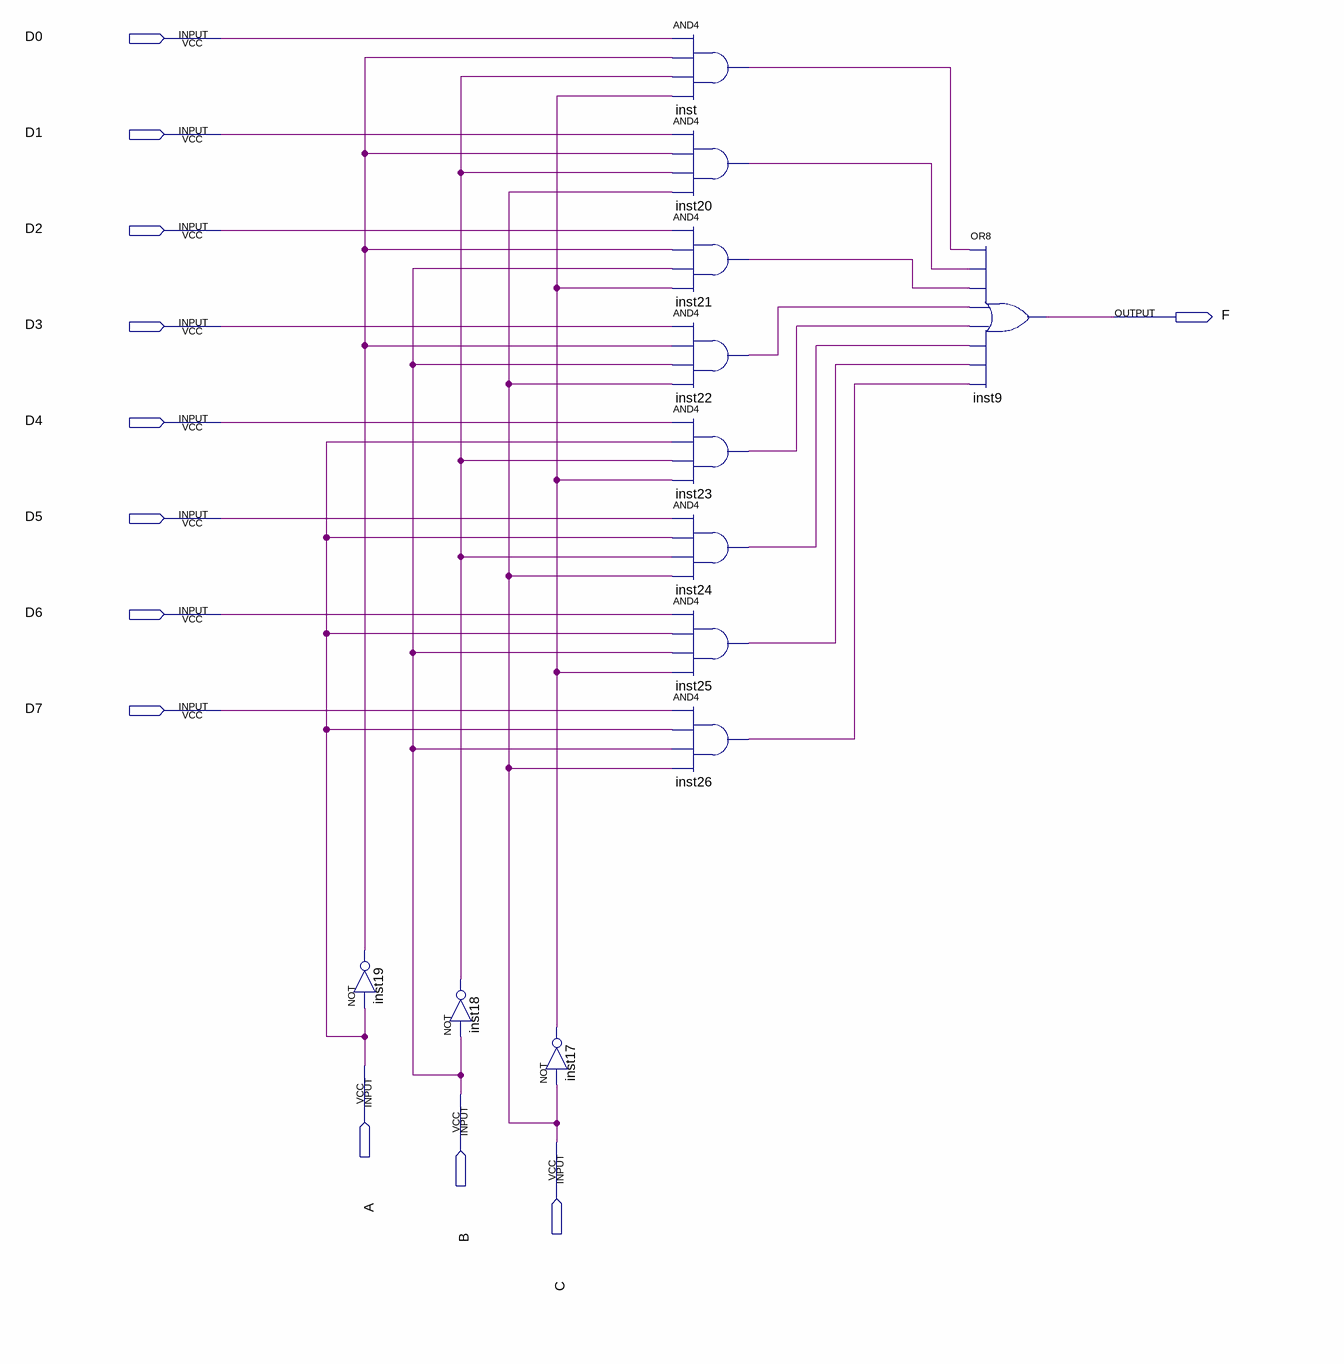
[diagram p0: schematic sheet]
// Quartus schematic multiplexer_8-1.bdf as structural Verilog: 12 symbols, 12 pins
module \multiplexer_8-1  (
  input  D0,
  input  D1,
  input  D2,
  input  D3,
  input  D4,
  input  D5,
  input  D6,
  input  D7,
  input  A,
  input  B,
  input  C,
  output F
);

  wire inst17_out, inst18_out, inst19_out, inst20_out, inst21_out, inst22_out, inst23_out, inst24_out,
       inst25_out, inst26_out, inst_out;

  not inst19 (inst19_out, A);
  not inst18 (inst18_out, B);
  not inst17 (inst17_out, C);
  and inst (inst_out, D0, inst19_out, inst18_out, inst17_out);
  and inst20 (inst20_out, D1, inst19_out, inst18_out, C);
  and inst21 (inst21_out, D2, inst19_out, B, inst17_out);
  and inst22 (inst22_out, D3, inst19_out, B, C);
  and inst23 (inst23_out, D4, A, inst18_out, inst17_out);
  and inst24 (inst24_out, D5, A, inst18_out, C);
  and inst25 (inst25_out, D6, A, B, inst17_out);
  and inst26 (inst26_out, D7, A, B, C);
  or inst9 (F, inst_out, inst20_out, inst21_out, inst22_out, inst23_out, inst24_out, inst25_out, inst26_out);
endmodule
